# Altium schematic sheet Main.SchDoc: ТО2192
size 209 x 297 mm; ApprovedBy: Кубатко В.А.; CheckedBy: Кубатко В.А.; Author: Сергеев Д.А.; CompanyName: ГК "СНАБЖЕНИЕ"; DrawnBy: Сергеев Д.А,; Engineer: Сергеев Д.А.; Organization: ГК "СНАБЖЕНИЕ"; DocumentNumber: ТО2192; Revision: 1; SheetNumber: 1; SheetTotal: 4
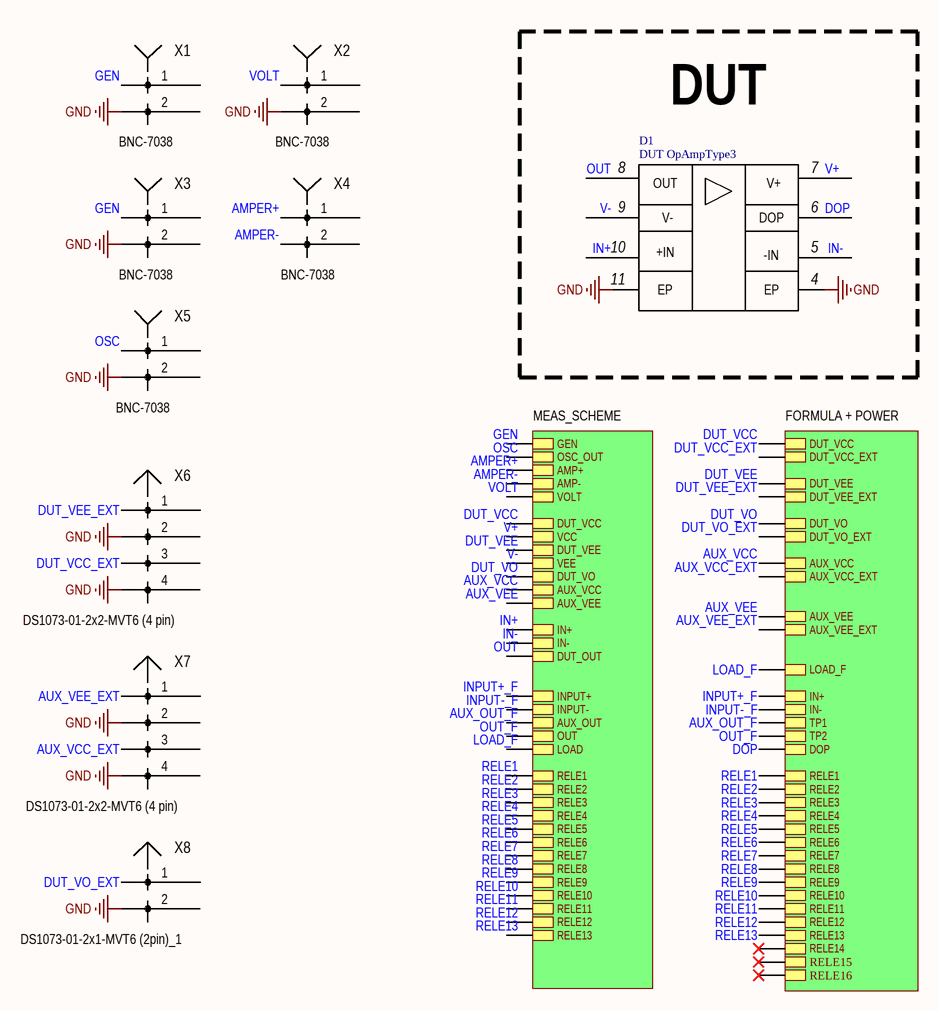
[diagram p0: Main.SchDoc]

## Parts
D1  DUT OpAmpType3  [DIP 14]
X1  BNC-7038  [BNC-7038]
X2  BNC-7038  [BNC-7038]
X3  BNC-7038  [BNC-7038]
X4  BNC-7038  [BNC-7038]
X5  BNC-7038  [BNC-7038]
X6  DS1073-01-2x2-MVT6 (4 pin)  [DS1073-01-2x2-MVT6 (4 pin)]
X7  DS1073-01-2x2-MVT6 (4 pin)  [DS1073-01-2x2-MVT6 (4 pin)]
X8  DS1073-01-2x1-MVT6 (2pin)_1  [DS1073-01-2x1-MVT6 (2 pin) - duplicate]

## Blocks framed on the sheet
DUT: D1

## Sub-sheets
FORMULA + POWER = FORMULA.SchDoc: DUT_VEE, DUT_VCC, DUT_VO, RELE1, RELE9, RELE11, RELE5, RELE2, RELE7, RELE13, RELE12, RELE14, RELE4, RELE6, RELE3, RELE8, RELE10, AUX_VCC, DUT_VCC_EXT, AUX_VEE_EXT, DUT_VO_EXT, AUX_VEE, AUX_VCC_EXT, DUT_VEE_EXT, IN-, TP1, DOP, IN+, TP2, LOAD_F, RELE15, RELE16
MEAS_SCHEME = MEAS_SCHEME.SchDoc: GEN, OSC_OUT, AMP-, VOLT, DUT_VEE, VCC, AMP+, VEE, RELE2, DUT_VCC, RELE5, RELE4, RELE6, RELE3, RELE9, RELE10, RELE13, DUT_VO, IN-, RELE8, RELE12, RELE11, IN+, AUX_VEE, RELE7, AUX_VCC, OUT, AUX_OUT, INPUT-, INPUT+, DUT_OUT, LOAD, RELE1

## Nets
GND: D1.4 D1.11 X1.2 X2.2 X3.2 X5.2 X6.2 X6.4 X7.2 X7.4 X8.2
AMPER+: X4.1 ; sheet MEAS_SCHEME/AMP+
AMPER-: X4.2 ; sheet MEAS_SCHEME/AMP-
AUX_OUT_F: sheet FORMULA + POWER/TP1, sheet MEAS_SCHEME/AUX_OUT
AUX_VCC: sheet FORMULA + POWER/AUX_VCC, sheet MEAS_SCHEME/AUX_VCC
AUX_VCC_EXT: X7.3 ; sheet FORMULA + POWER/AUX_VCC_EXT
AUX_VEE: sheet FORMULA + POWER/AUX_VEE, sheet MEAS_SCHEME/AUX_VEE
AUX_VEE_EXT: X7.1 ; sheet FORMULA + POWER/AUX_VEE_EXT
DOP: D1.6 ; sheet FORMULA + POWER/DOP
DUT_VCC: sheet FORMULA + POWER/DUT_VCC, sheet MEAS_SCHEME/DUT_VCC
DUT_VCC_EXT: X6.3 ; sheet FORMULA + POWER/DUT_VCC_EXT
DUT_VEE: sheet FORMULA + POWER/DUT_VEE, sheet MEAS_SCHEME/DUT_VEE
DUT_VEE_EXT: X6.1 ; sheet FORMULA + POWER/DUT_VEE_EXT
DUT_VO: sheet FORMULA + POWER/DUT_VO, sheet MEAS_SCHEME/DUT_VO
DUT_VO_EXT: X8.1 ; sheet FORMULA + POWER/DUT_VO_EXT
GEN: X1.1 X3.1 ; sheet MEAS_SCHEME/GEN
IN+: D1.10 ; sheet MEAS_SCHEME/IN+
IN-: D1.5 ; sheet MEAS_SCHEME/IN-
INPUT+_F: sheet FORMULA + POWER/IN+, sheet MEAS_SCHEME/INPUT+
INPUT-_F: sheet FORMULA + POWER/IN-, sheet MEAS_SCHEME/INPUT-
LOAD_F: sheet FORMULA + POWER/LOAD_F, sheet MEAS_SCHEME/LOAD
OSC: X5.1 ; sheet MEAS_SCHEME/OSC_OUT
OUT: D1.8 ; sheet MEAS_SCHEME/DUT_OUT
OUT_F: sheet FORMULA + POWER/TP2, sheet MEAS_SCHEME/OUT
RELE1: sheet FORMULA + POWER/RELE1, sheet MEAS_SCHEME/RELE1
RELE2: sheet FORMULA + POWER/RELE2, sheet MEAS_SCHEME/RELE2
RELE3: sheet FORMULA + POWER/RELE3, sheet MEAS_SCHEME/RELE3
RELE4: sheet FORMULA + POWER/RELE4, sheet MEAS_SCHEME/RELE4
RELE5: sheet FORMULA + POWER/RELE5, sheet MEAS_SCHEME/RELE5
RELE6: sheet FORMULA + POWER/RELE6, sheet MEAS_SCHEME/RELE6
RELE7: sheet FORMULA + POWER/RELE7, sheet MEAS_SCHEME/RELE7
RELE8: sheet FORMULA + POWER/RELE8, sheet MEAS_SCHEME/RELE8
RELE9: sheet FORMULA + POWER/RELE9, sheet MEAS_SCHEME/RELE9
RELE10: sheet FORMULA + POWER/RELE10, sheet MEAS_SCHEME/RELE10
RELE11: sheet FORMULA + POWER/RELE11, sheet MEAS_SCHEME/RELE11
RELE12: sheet FORMULA + POWER/RELE12, sheet MEAS_SCHEME/RELE12
RELE13: sheet FORMULA + POWER/RELE13, sheet MEAS_SCHEME/RELE13
V+: D1.7 ; sheet MEAS_SCHEME/VCC
V-: D1.9 ; sheet MEAS_SCHEME/VEE
VOLT: X2.1 ; sheet MEAS_SCHEME/VOLT

## Notes on the sheet
- Перв. примен.
- Справ. №
- Подп. и дата
- Инв. № дубл.
- Взам. инв. №
- Разраб.
- Изм.
- Лист
- № докум.
- Подп.
- Дата
- Литера
- Масса
- Масштаб
- Пров.
- Т.контр.
- Листов
- Инв. № подл.
- Н.контр.
- Утв.
- Форма 1 ГОСТ 2.104-2006
- Копировал
- Формат А4
- (in symbol OpAmpType3) OUT; V+; V-; DOP; +IN; -IN; EP

## Library data of the parts
D1 = OpAmpType3
X6 X7 = DS1073-01-2x2-MVT6 (4 pin): ComponentHeigt: 5.5; Name: Вилка; Specification: Вилка PLD2-2 *; Typ: PLD2-2; ClassName: *; Component Link: *; ComponentWeigt: *; Firme: *; Leadform: *; NN: *; KIND: *
X8 = DS1073-01-2x1-MVT6 (2pin)_1: ComponentHeigt: 5.5; Name: Вилка; Specification: Вилка PLD2-2 *; Typ: PLD2-2; ClassName: *; Component Link: *; ComponentWeigt: *; Firme: *; Leadform: *; NN: *; KIND: *